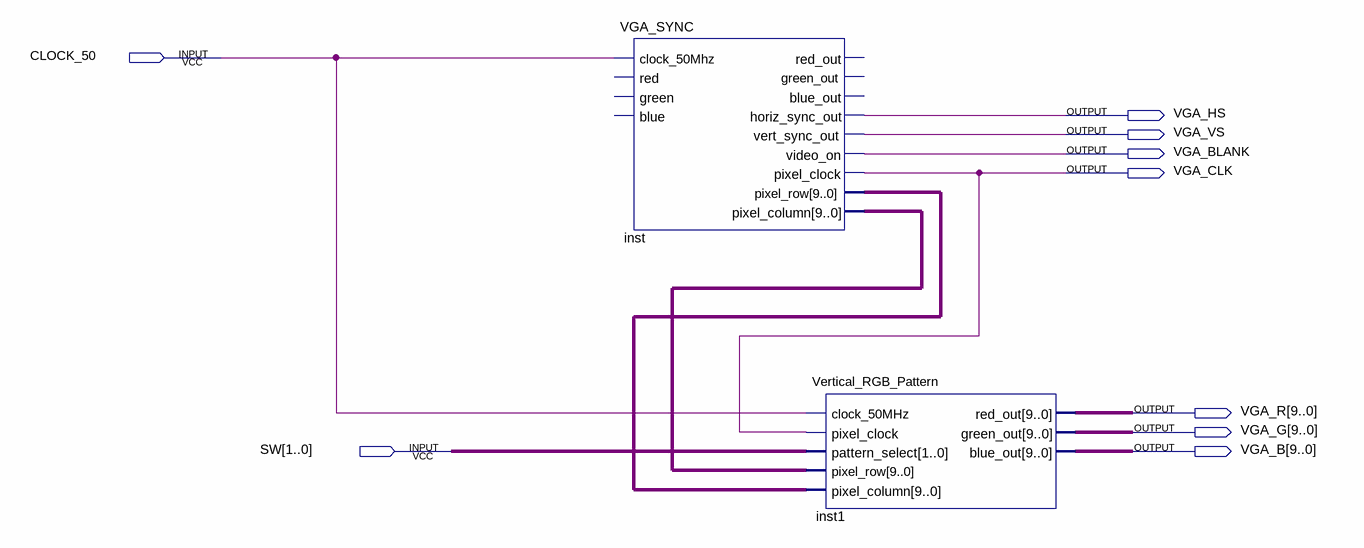
[diagram p0: schematic sheet]
// Quartus schematic Vertical_Pattern.bdf as structural Verilog: 2 symbols, 9 pins
module Vertical_Pattern (
  input  CLOCK_50,
  input  [1:0] SW,
  output VGA_HS,
  output VGA_VS,
  output VGA_BLANK,
  output VGA_CLK,
  output [9:0] VGA_R,
  output [9:0] VGA_G,
  output [9:0] VGA_B
);

  wire [9:0] inst_pixel_column, inst_pixel_row;

  VGA_SYNC inst (
    .clock_50Mhz(CLOCK_50), .horiz_sync_out(VGA_HS), .vert_sync_out(VGA_VS), .video_on(VGA_BLANK),
    .pixel_clock(VGA_CLK), .pixel_row(inst_pixel_row), .pixel_column(inst_pixel_column));  // open: red, green, blue, red_out, green_out, blue_out
  Vertical_RGB_Pattern inst1 (
    .clock_50MHz(CLOCK_50), .pixel_clock(VGA_CLK), .pattern_select(SW), .pixel_row(inst_pixel_column),
    .pixel_column(inst_pixel_row), .red_out(VGA_R), .green_out(VGA_G), .blue_out(VGA_B));
endmodule
